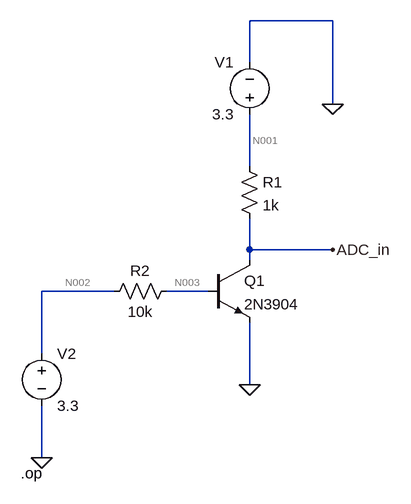
[diagram p0: schematic BJT_NPN.asc]
BJT_NPN.asc, the LTspice schematic file:
Version 4
SHEET 1 880 728
WIRE 288 16 160 16
WIRE 160 80 160 16
WIRE 288 144 288 16
WIRE 160 240 160 160
WIRE 160 368 160 320
WIRE 288 368 160 368
WIRE 160 384 160 368
WIRE -48 432 -160 432
WIRE 96 432 32 432
WIRE -160 528 -160 432
WIRE 160 576 160 480
WIRE -160 688 -160 608
FLAG 160 576 0
FLAG -160 688 0
FLAG 288 144 0
FLAG 288 368 ADC_in
SYMBOL voltage 160 176 R180
WINDOW 0 24 96 Left 2
WINDOW 3 24 16 Left 2
SYMATTR InstName V1
SYMATTR Value 3.3
SYMBOL res 144 224 R0
SYMATTR InstName R1
SYMATTR Value 1k
SYMBOL npn 96 384 R0
SYMATTR InstName Q1
SYMATTR Value 2N3904
SYMBOL voltage -160 512 R0
WINDOW 123 0 0 Left 0
WINDOW 39 0 0 Left 0
SYMATTR InstName V2
SYMATTR Value 3.3
SYMBOL res 48 416 R90
WINDOW 0 0 56 VBottom 2
WINDOW 3 32 56 VTop 2
SYMATTR InstName R2
SYMATTR Value 10k
TEXT -192 712 Left 2 !.op

The netlist it stands for:
* BJT_NPN.asc
V1 N001 0 3.3
R1 N001 ADC_in 1k
Q1 ADC_in N003 0 0 2N3904
V2 N002 0 3.3
R2 N003 N002 10k
.model NPN NPN
.model PNP PNP
.lib standard.bjt
.op
.backanno
.end

* Results of the author's LTspice run, read from the files saved beside the schematic
* Operating Point:
*   V(n001) = 3.3 V
*   V(adc_in) = 40.38 mV
*   V(n003) = 699.8 mV
*   V(n002) = 3.3 V
*   Ic(Q1) = 3.26 mA
*   Ib(Q1) = 260 µA
*   Ie(Q1) = -3.52 mA
*   I(R1) = 3.26 mA
*   I(R2) = -260 µA
*   I(V1) = -3.26 mA
*   I(V2) = -260 µA
* From the log:
*   Semiconductor Device Operating Points:
*                           --- Bipolar Transistors ---
*   Name:       q1
*   Model:    2n3904
*   Ib:       2.60e-04
*   Ic:       3.26e-03
*   Vbe:      7.00e-01
*   Vbc:      6.59e-01
*   Vce:      4.04e-02
*   BetaDC:   1.25e+01
*   Gm:       1.34e-01
*   Rpi:      1.71e+03
*   Rx:       2.00e+01
*   Ro:       2.69e+01
*   Cbe:      7.27e-11
*   Cbc:      9.47e-09
*   Cjs:      0.00e+00
*   BetaAC:   2.29e+02
*   Cbx:      0.00e+00
*   Ft:       2.23e+06